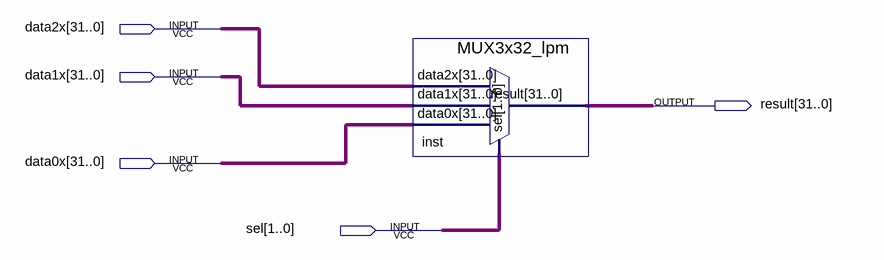
[diagram p0: schematic sheet]
// Quartus schematic MUX3x32.bdf as structural Verilog: 1 symbols, 5 pins
module MUX3x32 (
  input  [31:0] data2x,
  input  [31:0] data1x,
  input  [31:0] data0x,
  input  [1:0] sel,
  output [31:0] result
);

  MUX3x32_lpm inst (.data2x(data2x), .data1x(data1x), .data0x(data0x), .sel(sel), .result(result));
endmodule
